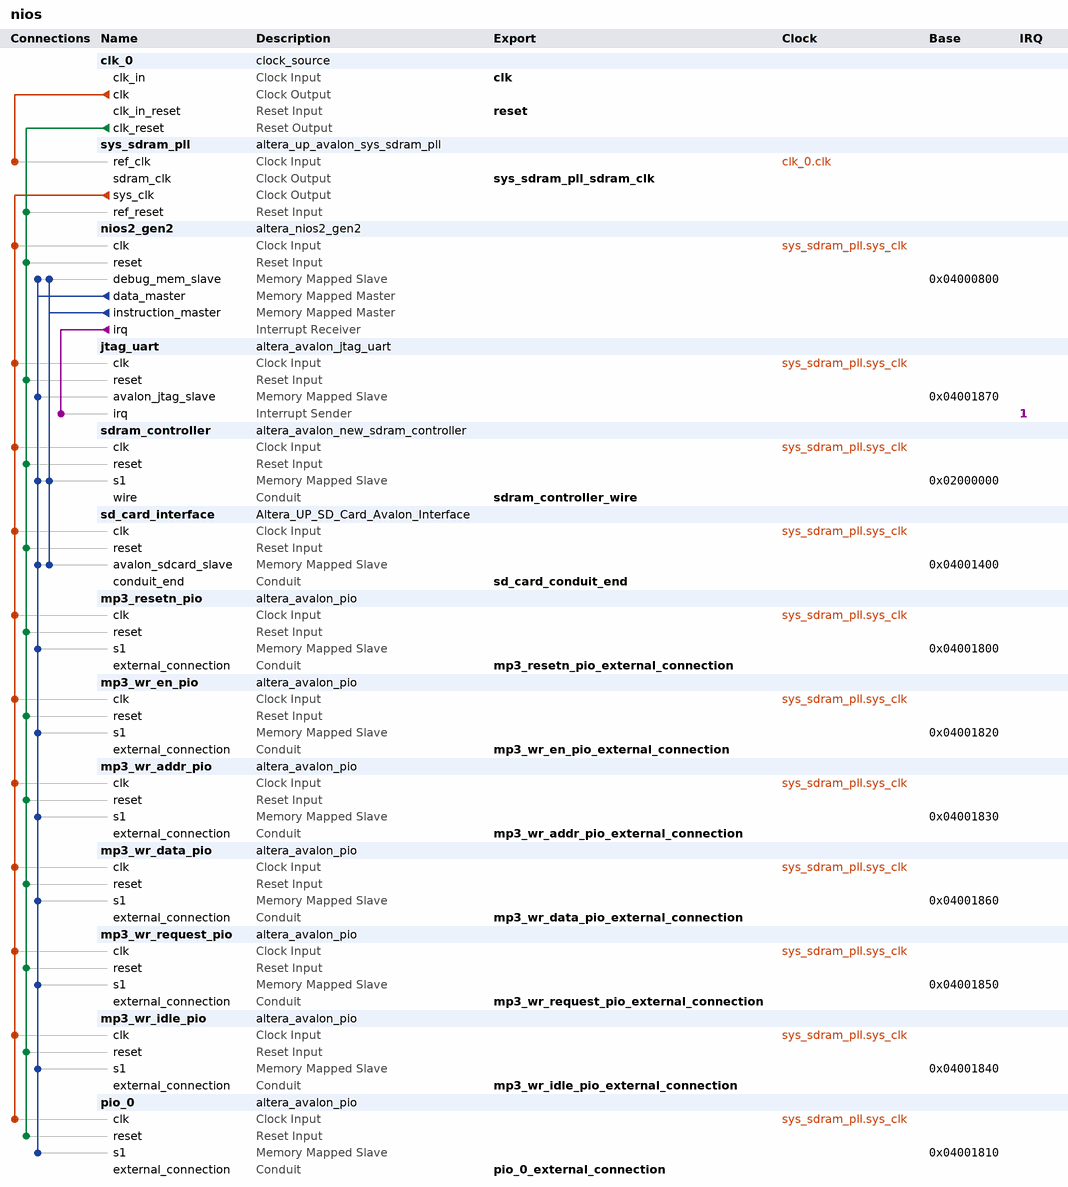
[diagram p0: system contents]
# Platform Designer (Qsys) system nios, Cyclone IV E EP4CE10F17C8
# Parameters at their usual value, and those the tool derives, are not listed.
package require -exact qsys 17.1
create_system nios
set_project_property DEVICE_FAMILY {Cyclone IV E}
set_project_property DEVICE EP4CE10F17C8

add_instance clk_0 clock_source 17.1
set_instance_parameter_value clk_0 clockFrequency 50000000

add_instance sys_sdram_pll altera_up_avalon_sys_sdram_pll 17.1
set_instance_parameter_value sys_sdram_pll CIV_boards DE0-Nano
set_instance_parameter_value sys_sdram_pll CV_boards DE10-Standard
set_instance_parameter_value sys_sdram_pll gui_outclk 50.0
set_instance_parameter_value sys_sdram_pll gui_refclk 50.0

add_instance nios2_gen2 altera_nios2_gen2 17.1
set_instance_parameter_value nios2_gen2 dcache_size 2048
set_instance_parameter_value nios2_gen2 exceptionSlave sdram_controller.s1
set_instance_parameter_value nios2_gen2 icache_size 4096
set_instance_parameter_value nios2_gen2 impl Tiny
set_instance_parameter_value nios2_gen2 resetSlave sdram_controller.s1

add_instance jtag_uart altera_avalon_jtag_uart 17.1
set_instance_parameter_value jtag_uart simInteractiveOptions NO_INTERACTIVE_WINDOWS

add_instance sdram_controller altera_avalon_new_sdram_controller 17.1
set_instance_parameter_value sdram_controller TAC 5.5
set_instance_parameter_value sdram_controller TRCD 20.0
set_instance_parameter_value sdram_controller TRP 20.0
set_instance_parameter_value sdram_controller casLatency 3
set_instance_parameter_value sdram_controller columnWidth 9
set_instance_parameter_value sdram_controller dataWidth 16
set_instance_parameter_value sdram_controller generateSimulationModel false
set_instance_parameter_value sdram_controller model single_Micron_MT48LC4M32B2_7_chip
set_instance_parameter_value sdram_controller numberOfBanks 4
set_instance_parameter_value sdram_controller numberOfChipSelects 1
set_instance_parameter_value sdram_controller powerUpDelay 100.0
set_instance_parameter_value sdram_controller refreshPeriod 15.625
set_instance_parameter_value sdram_controller rowWidth 13

add_instance sd_card_interface Altera_UP_SD_Card_Avalon_Interface 17.1

add_instance mp3_resetn_pio altera_avalon_pio 17.1
set_instance_parameter_value mp3_resetn_pio direction Output
set_instance_parameter_value mp3_resetn_pio width 1

add_instance mp3_wr_en_pio altera_avalon_pio 17.1
set_instance_parameter_value mp3_wr_en_pio direction Output
set_instance_parameter_value mp3_wr_en_pio width 1

add_instance mp3_wr_addr_pio altera_avalon_pio 17.1
set_instance_parameter_value mp3_wr_addr_pio direction Output
set_instance_parameter_value mp3_wr_addr_pio width 10

add_instance mp3_wr_data_pio altera_avalon_pio 17.1
set_instance_parameter_value mp3_wr_data_pio direction Output
set_instance_parameter_value mp3_wr_data_pio width 16

add_instance mp3_wr_request_pio altera_avalon_pio 17.1
set_instance_parameter_value mp3_wr_request_pio direction Input
set_instance_parameter_value mp3_wr_request_pio width 1

add_instance mp3_wr_idle_pio altera_avalon_pio 17.1
set_instance_parameter_value mp3_wr_idle_pio direction Output
set_instance_parameter_value mp3_wr_idle_pio width 1

add_instance pio_0 altera_avalon_pio 17.1
set_instance_parameter_value pio_0 direction Input
set_instance_parameter_value pio_0 width 22

# connections
add_connection clk_0.clk sys_sdram_pll.ref_clk clock
add_connection sys_sdram_pll.sys_clk jtag_uart.clk clock
add_connection sys_sdram_pll.sys_clk mp3_resetn_pio.clk clock
add_connection sys_sdram_pll.sys_clk mp3_wr_addr_pio.clk clock
add_connection sys_sdram_pll.sys_clk mp3_wr_data_pio.clk clock
add_connection sys_sdram_pll.sys_clk mp3_wr_en_pio.clk clock
add_connection sys_sdram_pll.sys_clk mp3_wr_idle_pio.clk clock
add_connection sys_sdram_pll.sys_clk mp3_wr_request_pio.clk clock
add_connection sys_sdram_pll.sys_clk nios2_gen2.clk clock
add_connection sys_sdram_pll.sys_clk pio_0.clk clock
add_connection sys_sdram_pll.sys_clk sd_card_interface.clk clock
add_connection sys_sdram_pll.sys_clk sdram_controller.clk clock
add_connection clk_0.clk_reset jtag_uart.reset reset
add_connection clk_0.clk_reset mp3_resetn_pio.reset reset
add_connection clk_0.clk_reset mp3_wr_addr_pio.reset reset
add_connection clk_0.clk_reset mp3_wr_data_pio.reset reset
add_connection clk_0.clk_reset mp3_wr_en_pio.reset reset
add_connection clk_0.clk_reset mp3_wr_idle_pio.reset reset
add_connection clk_0.clk_reset mp3_wr_request_pio.reset reset
add_connection clk_0.clk_reset nios2_gen2.reset reset
add_connection clk_0.clk_reset pio_0.reset reset
add_connection clk_0.clk_reset sd_card_interface.reset reset
add_connection clk_0.clk_reset sdram_controller.reset reset
add_connection clk_0.clk_reset sys_sdram_pll.ref_reset reset
add_connection nios2_gen2.data_master jtag_uart.avalon_jtag_slave avalon
set_connection_parameter_value nios2_gen2.data_master/jtag_uart.avalon_jtag_slave baseAddress 0x04001870
add_connection nios2_gen2.data_master mp3_resetn_pio.s1 avalon
set_connection_parameter_value nios2_gen2.data_master/mp3_resetn_pio.s1 baseAddress 0x04001800
add_connection nios2_gen2.data_master mp3_wr_addr_pio.s1 avalon
set_connection_parameter_value nios2_gen2.data_master/mp3_wr_addr_pio.s1 baseAddress 0x04001830
add_connection nios2_gen2.data_master mp3_wr_data_pio.s1 avalon
set_connection_parameter_value nios2_gen2.data_master/mp3_wr_data_pio.s1 baseAddress 0x04001860
add_connection nios2_gen2.data_master mp3_wr_en_pio.s1 avalon
set_connection_parameter_value nios2_gen2.data_master/mp3_wr_en_pio.s1 baseAddress 0x04001820
add_connection nios2_gen2.data_master mp3_wr_idle_pio.s1 avalon
set_connection_parameter_value nios2_gen2.data_master/mp3_wr_idle_pio.s1 baseAddress 0x04001840
add_connection nios2_gen2.data_master mp3_wr_request_pio.s1 avalon
set_connection_parameter_value nios2_gen2.data_master/mp3_wr_request_pio.s1 baseAddress 0x04001850
add_connection nios2_gen2.data_master nios2_gen2.debug_mem_slave avalon
set_connection_parameter_value nios2_gen2.data_master/nios2_gen2.debug_mem_slave baseAddress 0x04000800
add_connection nios2_gen2.data_master pio_0.s1 avalon
set_connection_parameter_value nios2_gen2.data_master/pio_0.s1 baseAddress 0x04001810
add_connection nios2_gen2.data_master sd_card_interface.avalon_sdcard_slave avalon
set_connection_parameter_value nios2_gen2.data_master/sd_card_interface.avalon_sdcard_slave baseAddress 0x04001400
add_connection nios2_gen2.data_master sdram_controller.s1 avalon
set_connection_parameter_value nios2_gen2.data_master/sdram_controller.s1 baseAddress 0x02000000
add_connection nios2_gen2.instruction_master nios2_gen2.debug_mem_slave avalon
set_connection_parameter_value nios2_gen2.instruction_master/nios2_gen2.debug_mem_slave baseAddress 0x04000800
add_connection nios2_gen2.instruction_master sd_card_interface.avalon_sdcard_slave avalon
set_connection_parameter_value nios2_gen2.instruction_master/sd_card_interface.avalon_sdcard_slave baseAddress 0x04001400
add_connection nios2_gen2.instruction_master sdram_controller.s1 avalon
set_connection_parameter_value nios2_gen2.instruction_master/sdram_controller.s1 baseAddress 0x02000000
add_connection nios2_gen2.irq jtag_uart.irq interrupt
set_connection_parameter_value nios2_gen2.irq/jtag_uart.irq irqNumber 1

# exported interfaces
add_interface clk clock sink
set_interface_property clk EXPORT_OF clk_0.clk_in
add_interface mp3_resetn_pio_external_connection conduit end
set_interface_property mp3_resetn_pio_external_connection EXPORT_OF mp3_resetn_pio.external_connection
add_interface mp3_wr_addr_pio_external_connection conduit end
set_interface_property mp3_wr_addr_pio_external_connection EXPORT_OF mp3_wr_addr_pio.external_connection
add_interface mp3_wr_data_pio_external_connection conduit end
set_interface_property mp3_wr_data_pio_external_connection EXPORT_OF mp3_wr_data_pio.external_connection
add_interface mp3_wr_en_pio_external_connection conduit end
set_interface_property mp3_wr_en_pio_external_connection EXPORT_OF mp3_wr_en_pio.external_connection
add_interface mp3_wr_idle_pio_external_connection conduit end
set_interface_property mp3_wr_idle_pio_external_connection EXPORT_OF mp3_wr_idle_pio.external_connection
add_interface mp3_wr_request_pio_external_connection conduit end
set_interface_property mp3_wr_request_pio_external_connection EXPORT_OF mp3_wr_request_pio.external_connection
add_interface pio_0_external_connection conduit end
set_interface_property pio_0_external_connection EXPORT_OF pio_0.external_connection
add_interface reset reset sink
set_interface_property reset EXPORT_OF clk_0.clk_in_reset
add_interface sd_card_conduit_end conduit end
set_interface_property sd_card_conduit_end EXPORT_OF sd_card_interface.conduit_end
add_interface sdram_controller_wire conduit end
set_interface_property sdram_controller_wire EXPORT_OF sdram_controller.wire
add_interface sys_sdram_pll_sdram_clk clock source
set_interface_property sys_sdram_pll_sdram_clk EXPORT_OF sys_sdram_pll.sdram_clk

set_interconnect_requirement {$system} qsys_mm.clockCrossingAdapter HANDSHAKE
set_interconnect_requirement {$system} qsys_mm.enableEccProtection FALSE
set_interconnect_requirement {$system} qsys_mm.insertDefaultSlave FALSE
set_interconnect_requirement {$system} qsys_mm.maxAdditionalLatency 1

save_system nios.qsys
